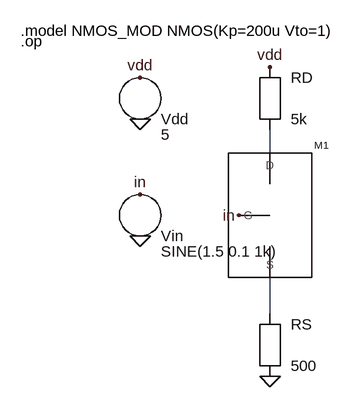
[diagram p0: schematic common_source_labelled.asc]
common_source_labelled.asc, the LTspice schematic file:
Version 4
SHEET 1 880 680
WIRE 400 204 400 168
WIRE 400 396 400 452
FLAG 400 72 vdd
FLAG 200 88 vdd
FLAG 200 152 0
FLAG 400 548 0
FLAG 352 300 in
FLAG 200 268 in
FLAG 200 332 0
SYMBOL nmos 400 300 R0
SYMATTR InstName M1
SYMATTR Value NMOS_MOD
SYMBOL res 400 120 R0
SYMATTR InstName RD
SYMATTR Value 5k
SYMBOL res 400 500 R0
SYMATTR InstName RS
SYMATTR Value 500
SYMBOL voltage 200 120 R0
SYMATTR InstName Vdd
SYMATTR Value 5
SYMBOL voltage 200 300 R0
SYMATTR InstName Vin
SYMATTR Value SINE(1.5 0.1 1k)
TEXT 16 16 Left 2 !.model NMOS_MOD NMOS(Kp=200u Vto=1)
TEXT 16 32 Left 2 !.op

The netlist it stands for:
* common_source_labelled.asc
M1 N001 in N002 N002 NMOS_MOD
RD vdd N001 5k
RS N002 0 500
Vdd vdd 0 5
Vin in 0 SINE(1.5 0.1 1k)
.model NMOS NMOS
.model PMOS PMOS
.lib standard.mos
.model NMOS_MOD NMOS(Kp=200u Vto=1)
.op
.backanno
.end